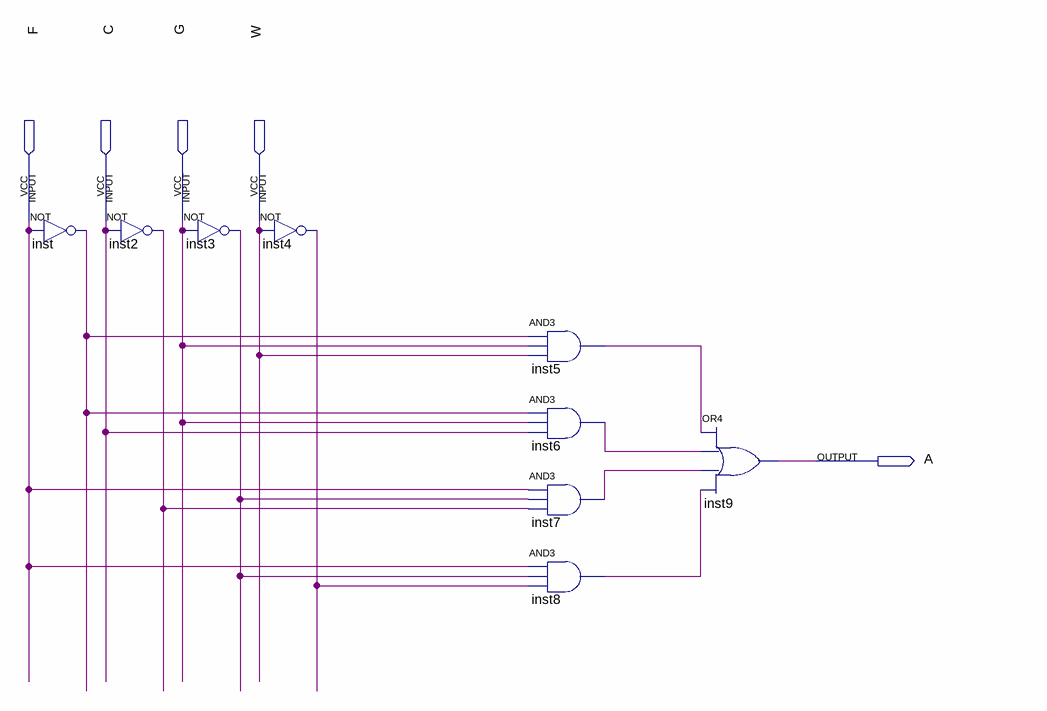
[diagram p0: schematic sheet]
// Quartus schematic lab3step3.bdf as structural Verilog: 9 symbols, 5 pins
module lab3step3 (
  input  F,
  input  C,
  input  G,
  input  W,
  output A
);

  wire inst2_out, inst3_out, inst4_out, inst5_out, inst6_out, inst7_out, inst8_out, inst_out;

  not inst (inst_out, F);
  not inst2 (inst2_out, C);
  not inst3 (inst3_out, G);
  not inst4 (inst4_out, W);
  and inst5 (inst5_out, inst_out, G, W);
  and inst6 (inst6_out, inst_out, G, C);
  and inst7 (inst7_out, F, inst3_out, inst2_out);
  and inst8 (inst8_out, F, inst3_out, inst4_out);
  or inst9 (A, inst5_out, inst6_out, inst7_out, inst8_out);
endmodule
